# Altium project Teleoperation_V1.1.PrjPcb (part 2 of 2)

## Sheet rp2040.SchDoc
size A3
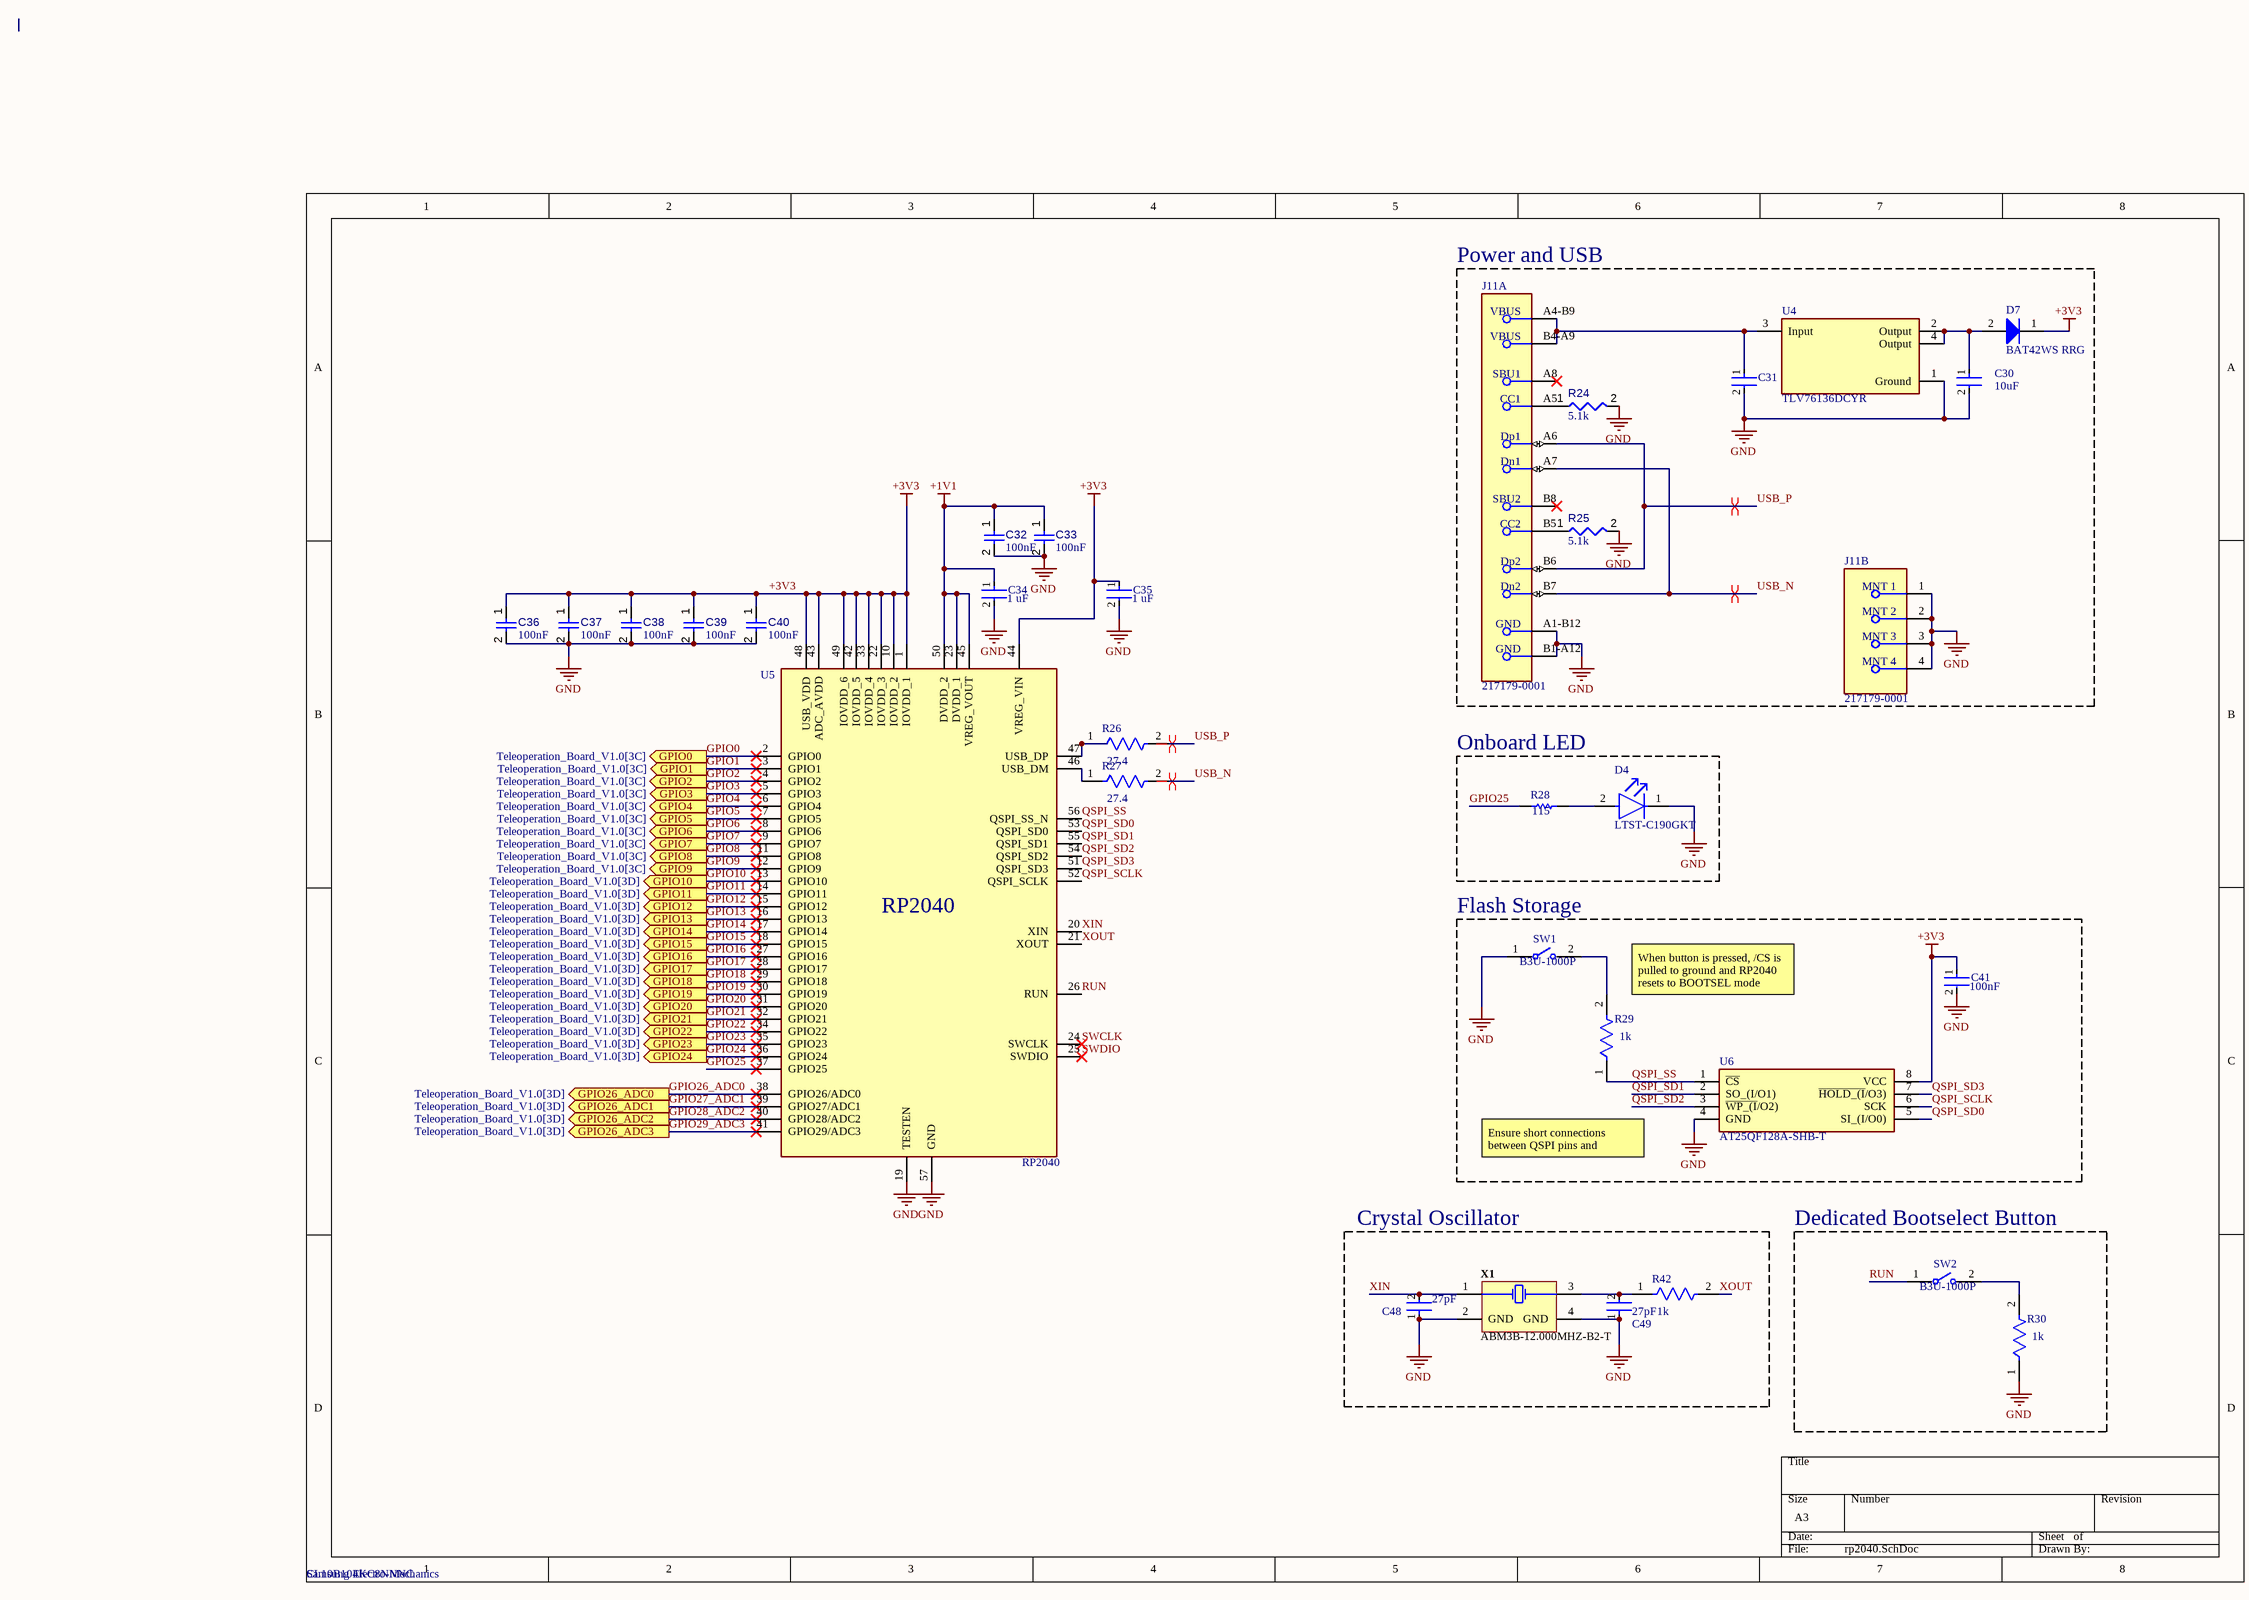
[diagram p2: rp2040.SchDoc]

### Parts
C30  Capacitance: 10uF  [FP-GRT188-0_2-MFG]  (hidden comment: GRT188R61E106ME13D)
C31  UMK107AB7105KA-T  [FP-0603-L_1_6_0_15-W_0_8-IPC_C]  (value not drawn)
C32  value 100nF  [CAPC1608X90N]  (hidden comment: CL10B104KC8NNNC)
C33  value 100nF  [CAPC1608X90N]  (hidden comment: CL10B104KC8NNNC)
C34  CC0603KPX7R7BB105  [FP-CC0603-DA-MFG]  (value not drawn)
C35  CC0603KPX7R7BB105  [FP-CC0603-DA-MFG]  (value not drawn)
C36  value 100nF  [CAPC1608X90N]  (hidden comment: CL10B104KC8NNNC)
C37  value 100nF  [CAPC1608X90N]  (hidden comment: CL10B104KC8NNNC)
C38  value 100nF  [CAPC1608X90N]  (hidden comment: CL10B104KC8NNNC)
C39  value 100nF  [CAPC1608X90N]  (hidden comment: CL10B104KC8NNNC)
C40  value 100nF  [CAPC1608X90N]  (hidden comment: CL10B104KC8NNNC)
C41  Manufacturer: Samsung Electro-Mechanics  [FP-CGA3E-0_3-0_1-IPC_A]  (hidden comment: CL10B104KC8NNNC)
C48  C0603C270J5GACTU  [FP-C0603C-CF-MFG]  (value not drawn)
C49  C0603C270J5GACTU  [FP-C0603C-CF-MFG]  (value not drawn)
D4  LTST-C190GKT  [FP-LTST-C190GKT-MFG]
D7  BAT42WS RRG  [BAT42WS RRG-Footprint-1]
J11  217179-0001  [FP-2171790001-MFG]  (parts A,B of 2)
R24  value 5.1k  [RESC1608X55N]  (hidden comment: ERJ-3EKF5101V)
R25  value 5.1k  [RESC1608X55N]  (hidden comment: ERJ-3EKF5101V)
R26  CRCW060327R4FKEA  [FP-CRCW0603-e3-MFG]  (value not drawn)
R27  CRCW060327R4FKEA  [FP-CRCW0603-e3-MFG]  (value not drawn)
R28  ERJ-3EKF1150V  [RESC1608X55X30NL15T15]  (value not drawn)
R29  RC0603FR-071KL  [FP-RC0603-0_55-IPC_C]  (value not drawn)
R30  RC0603FR-071KL  [FP-RC0603-0_55-IPC_C]  (value not drawn)
R42  RC0603FR-071KL  [FP-RC0603-0_55-IPC_C]  (value not drawn)
SW1  B3U-1000P  [FP-B3U-1000P-MFG]
SW2  B3U-1000P  [FP-B3U-1000P-MFG]
U4  TLV76136DCYR  [TLV76136DCYR-Footprint-1]
U5  RP2040  [RP2040TR7]
U6  AT25QF128A-SHB-T  [SOIC127P790X216-8N]
X1  ABM3B-12.000MHZ-B2-T  [ABRA-ABM3B-4_V]

### Blocks framed on the sheet
Power and USB: C30 C31 D7 J11 R24 R25 U4
Onboard LED: D4 R28
Flash Storage: C41 R29 SW1 U6
Crystal Oscillator: C48 C49 R42 X1
Dedicated Bootselect Button: R30 SW2

### Ports
GPIO0 (out, see Teleoperation_Board_V1.0[3C]), GPIO1 (out, see Teleoperation_Board_V1.0[3C]), GPIO2 (out, see Teleoperation_Board_V1.0[3C]), GPIO3 (out, see Teleoperation_Board_V1.0[3C]), GPIO4 (out, see Teleoperation_Board_V1.0[3C]), GPIO5 (out, see Teleoperation_Board_V1.0[3C]), GPIO6 (out, see Teleoperation_Board_V1.0[3C]), GPIO7 (out, see Teleoperation_Board_V1.0[3C]), GPIO8 (out, see Teleoperation_Board_V1.0[3C]), GPIO9 (out, see Teleoperation_Board_V1.0[3C]), GPIO10 (out, see Teleoperation_Board_V1.0[3D]), GPIO11 (out, see Teleoperation_Board_V1.0[3D]), GPIO12 (out, see Teleoperation_Board_V1.0[3D]), GPIO13 (out, see Teleoperation_Board_V1.0[3D]), GPIO14 (out, see Teleoperation_Board_V1.0[3D]), GPIO15 (out, see Teleoperation_Board_V1.0[3D]), GPIO16 (out, see Teleoperation_Board_V1.0[3D]), GPIO17 (out, see Teleoperation_Board_V1.0[3D]), GPIO18 (out, see Teleoperation_Board_V1.0[3D]), GPIO19 (out, see Teleoperation_Board_V1.0[3D]), GPIO20 (out, see Teleoperation_Board_V1.0[3D]), GPIO21 (out, see Teleoperation_Board_V1.0[3D]), GPIO22 (out, see Teleoperation_Board_V1.0[3D]), GPIO23 (out, see Teleoperation_Board_V1.0[3D]), GPIO24 (out, see Teleoperation_Board_V1.0[3D]), GPIO26_ADC0 (out, see Teleoperation_Board_V1.0[3D]), GPIO26_ADC1 (out, see Teleoperation_Board_V1.0[3D]), GPIO26_ADC2 (out, see Teleoperation_Board_V1.0[3D]), GPIO26_ADC3 (out, see Teleoperation_Board_V1.0[3D])

### Nets
+1V1: C32.1 C33.1 C34.1 U5.23(DVDD_1) U5.45(VREG_VOUT) U5.50(DVDD_2)
+3V3: C35.1 C36.1 C37.1 C38.1 C39.1 C40.1 C41.1 D7.1(K) U5.1(IOVDD_1) U5.10(IOVDD_2) U5.22(IOVDD_3) U5.33(IOVDD_4) U5.42(IOVDD_5) U5.43(ADC_AVDD) U5.44(VREG_VIN) U5.48(USB_VDD) U5.49(IOVDD_6) U6.8(VCC)
GND: C30.2 C31.2 C32.2 C33.2 C34.2 C35.2 C36.2 C37.2 C38.2 C39.2 C40.2 C41.2 C48.1 C49.1 D4.1(C) J11.1(MNT_1) J11.2(MNT_2) J11.3(MNT_3) J11.4(MNT_4) J11.A1-B12(GND) J11.B1-A12(GND) R24.2 R25.2 R30.1 SW1.1 U4.1(Ground) U5.19(TESTEN) U5.57(GND) U6.4(GND) X1.2(GND) X1.4(GND)
GPIO0: U5.2(GPIO0) ; port GPIO0
GPIO1: U5.3(GPIO1) ; port GPIO1
GPIO2: U5.4(GPIO2) ; port GPIO2
GPIO3: U5.5(GPIO3) ; port GPIO3
GPIO4: U5.6(GPIO4) ; port GPIO4
GPIO5: U5.7(GPIO5) ; port GPIO5
GPIO6: U5.8(GPIO6) ; port GPIO6
GPIO7: U5.9(GPIO7) ; port GPIO7
GPIO8: U5.11(GPIO8) ; port GPIO8
GPIO9: U5.12(GPIO9) ; port GPIO9
GPIO10: U5.13(GPIO10) ; port GPIO10
GPIO11: U5.14(GPIO11) ; port GPIO11
GPIO12: U5.15(GPIO12) ; port GPIO12
GPIO13: U5.16(GPIO13) ; port GPIO13
GPIO14: U5.17(GPIO14) ; port GPIO14
GPIO15: U5.18(GPIO15) ; port GPIO15
GPIO16: U5.27(GPIO16) ; port GPIO16
GPIO17: U5.28(GPIO17) ; port GPIO17
GPIO18: U5.29(GPIO18) ; port GPIO18
GPIO19: U5.30(GPIO19) ; port GPIO19
GPIO20: U5.31(GPIO20) ; port GPIO20
GPIO21: U5.32(GPIO21) ; port GPIO21
GPIO22: U5.34(GPIO22) ; port GPIO22
GPIO23: U5.35(GPIO23) ; port GPIO23
GPIO24: U5.36(GPIO24) ; port GPIO24
GPIO25: R28.1 U5.37(GPIO25)
GPIO26_ADC0: U5.38(GPIO26/ADC0) ; port GPIO26_ADC0
GPIO27_ADC1: U5.39(GPIO27/ADC1) ; port GPIO26_ADC1
GPIO28_ADC2: U5.40(GPIO28/ADC2) ; port GPIO26_ADC2
GPIO29_ADC3: U5.41(GPIO29/ADC3) ; port GPIO26_ADC3
QSPI_SCLK: U5.52(QSPI_SCLK) U6.6(SCK)
QSPI_SD0: U5.53(QSPI_SD0) U6.5(SI_(I/O0))
QSPI_SD1: U5.55(QSPI_SD1) U6.2(SO_(I/O1))
QSPI_SD2: U5.54(QSPI_SD2) U6.3(~{WP_(I}/O2))
QSPI_SD3: U5.51(QSPI_SD3) U6.7(~{HOLD_(I}/O3))
QSPI_SS: R29.1 U5.56(QSPI_SS_N) U6.1(~{CS})
RUN: SW2.1 U5.26(RUN)
SWCLK: U5.24(SWCLK)
SWDIO: U5.25(SWDIO)
USB_N: J11.A7(Dn1) J11.B7(Dn2) R27.2
USB_P: J11.A6(Dp1) J11.B6(Dp2) R26.2
XIN: C48.2 U5.20(XIN) X1.1(X1)
XOUT: R42.2 U5.21(XOUT)
NetC30_1: C30.1 D7.2(A) U4.2(Output) U4.4(Output)
NetC31_1: C31.1 J11.A4-B9(VBUS) J11.B4-A9(VBUS) U4.3(Input)
NetC49_2: C49.2 R42.1 X1.3(X2)
NetD4_2: D4.2(A) R28.2
NetJ11_A5: J11.A5(CC1) R24.1
NetJ11_B5: J11.B5(CC2) R25.1
NetR26_1: R26.1 U5.47(USB_DP)
NetR27_1: R27.1 U5.46(USB_DM)
NetR29_2: R29.2 SW1.2
NetR30_2: R30.2 SW2.2

Not connected (* = marked no-connect by the designer): J11 A8(SBU1)* B8(SBU2)*

### Layout directives
differential pair: (no net found under the mark), USB_N, USB_P

### Notes on the sheet
- (near C34) 1 uF
- (near C35) 1 uF
- 27.4
- (near R27) 27.4
- (near R28) 115
- (near U5) RP2040
- (near R29) 1k
- (near R29) When button is pressed, /CS is pulled to ground and RP2040 resets to BOOTSEL mode
- (near C41) 100nF
- Ensure short connections between QSPI pins and RP2040
- (near C48) 27pF
- 27pF
- (near R42) 1k
- (near R30) 1k

### Library data of the parts
C30 = CMP-06035-032378-1: Multi-Layer Ceramic Capacitor 10uF 25V X5R ±20% 0603 Paper T/R; Thickness: 0.035inch; Case/Package: 0603; Voltage Rating: 25V; Mount: Surface Mount; Packaging: Tape and Reel; Width: 0.031inch; Max Operating Temperature: 85°C; Case Code (Imperial): 0603; Ratings: AEC-Q200; Tolerance: 20%; Min Operating Temperature: -55°C; Case Code (Metric): 1608; Length: 0.063inch
C31 = CMP-2000-07531-4: Ceramic Capacitor General Use 1uF ±10% 50V X7R 0603; Series: M; Width: 0.031inch; Mount: Surface Mount; Radiation Hardening: No; Voltage Rating (DC): 50V; Packaging: Tape and Reel; Termination: SMD/SMT; Depth: 0.8mm; Case Code (Metric): 1608; Case Code (Imperial): 0603; Height: 0.8mm; Voltage Rating: 50V; Package Quantity: 1; Halogen Free: Halogen Free; Dielectric: X7R; Min Operating Temperature: -55°C; Length: 1.6mm; Construction: Flat; Tolerance: 10%; Thickness: 0.037inch; Max Operating Temperature: 125°C; Case/Package: 0603; Capacitance: 1uF; RoHS Compliant: Yes
C32 C33 C36-C40 = CMP-001-00090-1: Ceramic Capacitor, Multilayer, Ceramic, 100V, 10% +Tol, 10% -Tol, X7R, 15% TC, 0.1uF, Surface Mount, 0603; Case/Package: 0603; Min Operating Temperature: -55°C; Mounting Technology: Surface Mount; Capacitor Type: Ceramic; Max Operating Temperature: 125°C; Pins: 2; RoHS Compliant: Yes
C34 C35 = CMP-03422-001047-1: CC0603 1 uF X7R 10.00% 16 V; Manufacturer: YAGEO; Temperature Coefficient: 15%; Tolerance: 0.1; Voltage Rating: 16 V; Capacitance: 1 uF; Material: Ceramic; Value: 1 uF; Device Class L3: Ceramic Capacitors; Temperature Characteristic: X7R; Device Class L2: Capacitors; Temperature Range Low: -55°C; Footprint Url: http://www.yageo.com/exep/pages/download/literatures/UPY-C_GEN_24.pdf; Device Class L1: Passive Components; Temperature: -55°C to +125°C; RoHS: TRUE; ComponentLink2URL: http://www.yageo.com/documents/recent/UPY-GPHC_X7R_6.3V-to-50V_18.pdf; Mouser Description: Cap Ceramic 1uF 16V X7R 10% SMD 0603 125°C Paper T/R; Octopart: https://octopart.com/cc0603kpx7r7bb105-yageo-25629533; Automotive: No; Height: 0.9mm; Voltage: 16 V; Lead Free: Yes; Category: Cap; Package: CC0603-DA; Temperature Range High: +125°C; Manufacturer Part Number: CC0603KPX7R7BB105; ComponentLink2Description: Datasheet
C41 = CMP-2000-07546-2: Cap Ceramic 100nF 50V X7R 10% Pad SMD 0603 +125°C Automotive T/R; Weight: 7.1E-05oz; Composition: Ceramic; Max Operating Temperature: 125°C; Termination: SMD/SMT; Dielectric: X7R; Length: 1.6mm; Package Quantity: 1; REACH SVHC: No SVHC; Lead Free: Lead Free; Case Code (Metric): 1608; Min Operating Temperature: -55°C; Packaging: Tape and Reel; Tolerance: 10%; Voltage Rating: 50V; Case Code (Imperial): 0603; Capacitance: 100nF; Case/Package: 0603; Voltage Rating (DC): 50V; Depth: 0.8mm; Radiation Hardening: No; Ratings: AEC-Q200; Mount: Surface Mount; Voltage: 50V; Thickness: 0.035inch; Width: 0.8mm; Height: 0.8mm; Manufacturer Part Number: CL10B104KC8NNNC
C48 C49 = CMP-2006-03314-2: CAP CER 27PF 50V C0G/NP0 0603; Manufacturer: KEMET; Tolerance: 0.05; Material: Ceramic; Automotive Grade: Grade 1; Temperature Characteristic: C0G; Temperature Coefficient: 30ppm/°C; RoHS: TRUE; Lead Free: Yes; Automotive: Yes; Category: Cap; Digikey Description: CAP CER 27PF 50V C0G/NP0 0603; Device Class L3: Ceramic Capacitors; Capacitance: 27 pF; Temperature Range High: +125°C; Octopart: https://octopart.com/c0603c270j5gactu-kemet-136059; Value: 27 pF; Temperature Range Low: -55°C; ComponentLink2URL: https://api.kemet.com/component-edge/download/datasheet/C0603C100J5GACAUTO.pdf; Device Class L2: Capacitors; Mouser Description: Multilayer Ceramic Capacitors MLCC - SMD/SMT 50volts 27pF C0G 5%; Device Class L1: Passive Components; ComponentLink2Description: Datasheet; Voltage Rating: 50 V; Package: C0603C-CF; Height: 0.87mm; Temperature: -55°C to +125°C; Manufacturer Part Number: C0603C270J5GACTU
D4 = CMP-22017-000005-2: LED GREEN CLEAR CHIP SMD; Dominant Wavelength: 569nm; Reverse Voltage: 5V; Lens Color: Colorless; Viewing Angle: 130°; Voltage: 2V; Forward Current: 30mA; Power Dissipation: 100mW; Luminous Intensity: 6mcd; Number of LEDs: 1; Forward Voltage: 2.1V; Wavelength: 565nm; Test Current: 10mA; Min Operating Temperature: -55°C; Lens Style: Clear; Mount: Surface Mount; Width: 0.8mm; Packaging: Tape and Reel; Lens Transparency: Clear; Case Code (Metric): 1608; Depth: 0.8mm; Case Code (Imperial): 0603; Case/Package: 0603; Number of Pins: 2; Max Operating Temperature: 85°C; Lead Free: Lead Free; Number of Elements: 1; Length: 1.6mm; Height: 0.8mm; Package Quantity: 1; Power Rating: 100mW; Radiation Hardening: No; Illumination Color: Green; Color: Green
D7 = CMP-004-00032-1: Schottky Diode, 30V, 0.2A, Sod-323F Rohs Compliant: Yes; Manufacturer Lifecycle Status: ACTIVE; Lifecycle Status: Production
J11 = CMP-04767-000028-2: CONN RCP USB2.0 TYP C 24P SMD RA; NexarPartId: 117190526; Gender: Receptacle; Number of Contacts: 16; Current Rating: 1.25A; Voltage Rating: 30V; Min Operating Temperature: -40°C; USB Standard: USB 2.0; Height: 3.36mm; Contact Material: Gold, Nickel; Max Operating Temperature: 85°C
R24 R25 = CMP-009-00178-1: Fixed Resistor, Metal Glaze/thick Film, 0.1W, 5100ohm, 75V, 1% +/-Tol, 100ppm/Cel, Surface Mount, 0603; Power: 100mW; Case/Package: 0603; Tolerance: 1%; Min Operating Temperature: -55°C; Max Operating Temperature: 155°C; RoHS Compliant: Yes; Mounting Technology: Surface Mount; Pins: 2
R26 R27 = CMP-2000-03146-2: RES Thick Film, 27.4Ω, 1%, 0.1W, 100ppm/°C, 0603; Voltage Rating (DC): 75V; Max Power Dissipation: 100mW; Resistance: 27.4R; Case Code (Metric): 1608; Length: 1.55mm; Depth: 0.85mm; Package Quantity: 10; Voltage Rating: 75V; Power Rating: 100mW; Weight: 7.1E-05oz; Max Operating Temperature: 155°C; Temperature Coefficient: 100ppm/°C; Packaging: Tape and Reel; Lead Free: Lead Free; Number of Pins: 2; Height: 0.45mm; Military Standard: Not; Features: Automotive AEC-Q200; Contact Plating: Tin; Min Operating Temperature: -55°C; Composition: Thick Film; Mount: Surface Mount; Case/Package: 0603; Case Code (Imperial): 0603; Tolerance: 1%; Width: 0.85mm; Radiation Hardening: No; Number of Terminations: 2; Termination: SMD/SMT
R28 = CMP-2000-00205-1: Manufacturer: Panasonic; Part Number: ERJ-3EKF1150V
R29 R30 R42 = CMP-1659-00009-5: RES 1K OHM 1% 1/10W 0603; Resistance: 1kR; Voltage Rating: 50V; Power Rating: 100mW; Temperature Coefficient: 100ppm/°C; Military Standard: Not; REACH SVHC: No SVHC; Size Code: 0603; Features: Moisture Resistant; Number of Terminations: 2; Technology: THICK FILM; Series: RC; Case Code (Metric): 1608; Resistance Tolerance: 1%; Resistor Type: Thick Film; Termination: SMD/SMT; Contact Plating: Tin; Radiation Hardening: No; Min Operating Temperature: -55°C; Max Operating Temperature: 155°C; Packaging: Tape and Reel; Max Power Dissipation: 100mW; RoHS Compliant: Yes; Height: 0.45mm; Lead Free: Lead Free; Case/Package: 0603; Length: 1.6mm; Tolerance: 1%; Case Code (Imperial): 0603; Construction: Rectangular; Depth: 0.8mm
SW1 SW2 = CMP-2100-03586-2: SWITCH TACTILE SPST-NO 0.05A 12V; Contact Resistance: 100mR; Operating Force: 1.5N; Max Current Rating: 50mA; Switch Travel: 0.15mm; Actuator Type: Standard; Mechanical Life: 200000Cycles; Ratings: Dust Proof; Illumination Type: Non-Illuminated; Throw Configuration: SPST; Actuator Length: 0.4mm; Switch Function: Off-Mom; Height: 1.2mm; Width: 3mm; Weight: 0.000776oz; Contact Material: Silver; Max Voltage Rating (DC): 12V; Insulation Resistance: 100MR; Lead Free: Lead Free; Current Rating: 50mA; Termination: SMD/SMT; Length: 4mm; Voltage Rating (DC): 12V; Contact Current Rating: 50mA; Orientation: Straight; Depth: 2.5mm; Max Operating Temperature: 70°C; Packaging: Tape and Reel; Min Operating Temperature: -25°C; Package Quantity: 1; Mount: Surface Mount; Electrical Life: 200000Cycles
U4 = CMP-019-00054-3: 1A 16V high-PSRR linear voltage regulator 4-SOT-223 -40 to 125; Manufacturer Lifecycle Status: ACTIVE; Length: 6.5mm; RoHS: Compliant; Thickness: 1.6mm; Width: 3.5mm; Case/Package: SOT-223; Lifecycle Status: Production; Pins: 4; Height: 1.8mm
U5 = RP2040: Integrated Circuit; Manufacturer_Name: RASPBERRY-PI; Datasheet Link: https://datasheets.raspberrypi.org/rp2040/rp2040-datasheet.pdf; Height: 0.9mm; Manufacturer_Part_Number: RP2040
U6 = AT25QF128A-SHB-T: Integrated Circuit; Manufacturer_Name: Renesas Electronics; Datasheet Link: https://www.renesas.com/us/en/products/memory-logic/non-volatile-memory/spi-nor-flash/dual-quad-spi-memory/at25qf128a-128mbit-3v-spi-serial-flash-memory-dual-io-and-quad-io-support; Height: 2.16mm; Manufacturer_Part_Number: AT25QF128A-SHB-T; Mouser Part Number: 988-AT25QF128A-SHB-T; Mouser Price/Stock: https://www.mouser.co.uk/ProductDetail/Renesas-Dialog/AT25QF128A-SHB-T?qs=IS%252B4QmGtzzpXzyCQuAC%2FQA%3D%3D
X1 = CMP-003-00015-2: Ceramic SMD Crystal, 12 MHz, +/- 20 ppm, 18 pF, -20 to 70 degC, 4-Pin SMD, RoHS, Tape and Reel; Manufacturer: Abracon; ESR: 70; Load Capacitance: 18pF; Tolerance: 20ppm; Frequency: 12MHz; Resistance: 70Ohm; Mounting Technology: SM; Packaging: TapeandReel; Datasheet URL: http://www.abracon.com/Resonators/abm3b.pdf; Manufacturer URL: http://www.abracon.com/; RoHS Compliant: True; Frequency Tolerance: 20ppm; Datasheet Version: Aug-15; Max Operating Temperature: 70°C; Package Reference: ABM3B; Min Operating Temperature: -20°C; Pins: 4; Package Quantity: 1000; Package Description: 4-Pin Surface Mount Device, Body 5 x 3.2 mm; Case/Package: CSMD

## Sheet voltage_dividers.SchDoc
size A
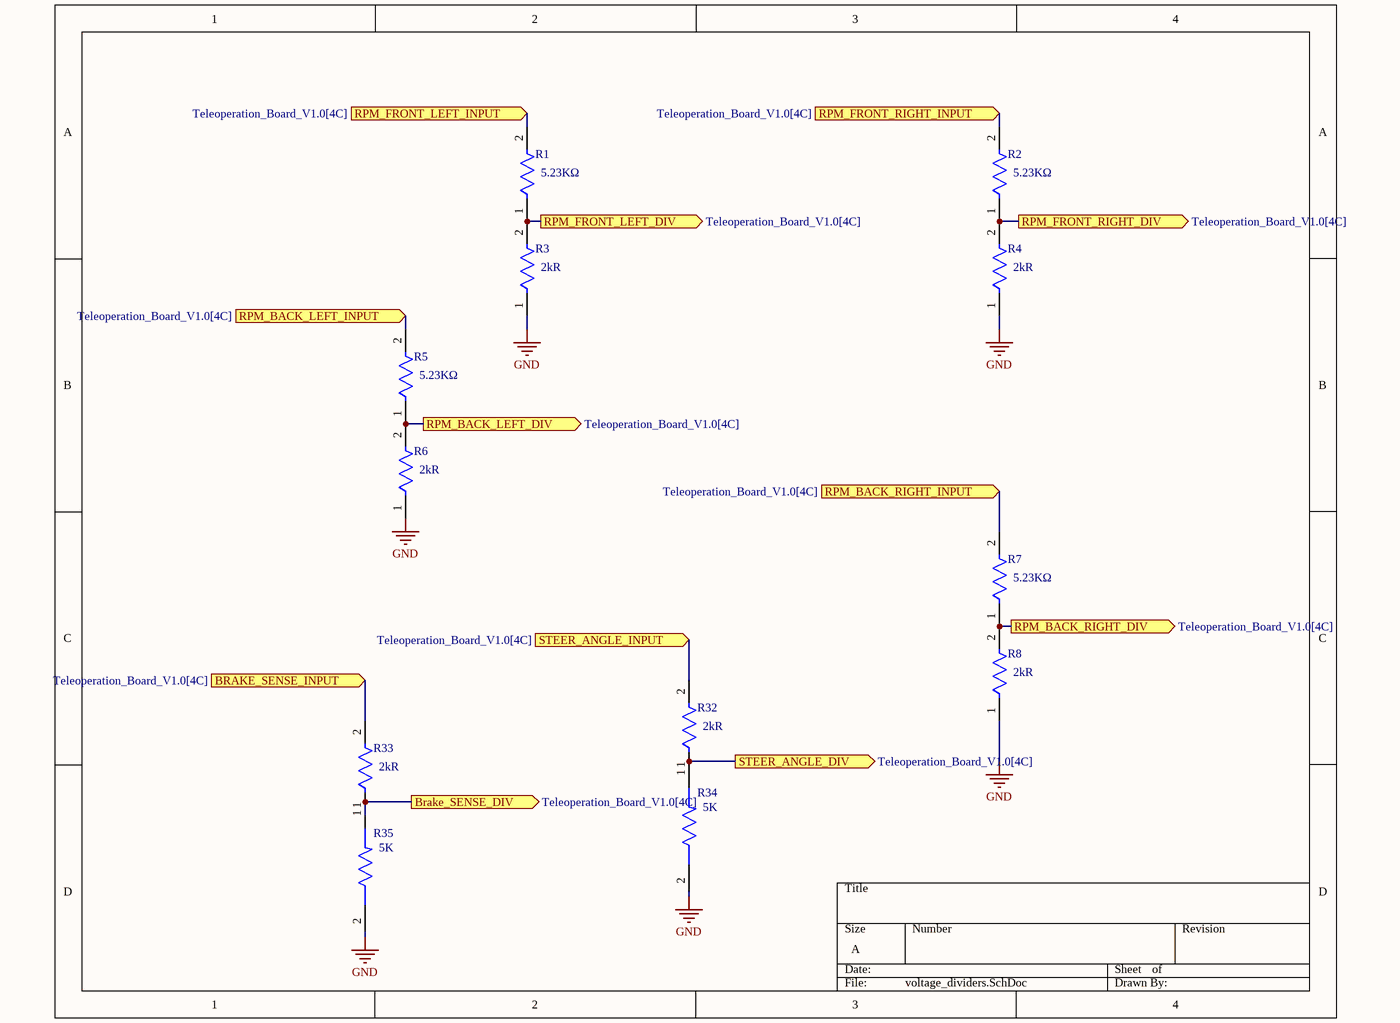
[diagram p3: voltage_dividers.SchDoc]

### Parts
R1  Resistance: 5.23KΩ  [FP-RT0603-MFG]  (hidden comment: RT0603BRD075K23L)
R2  Resistance: 5.23KΩ  [FP-RT0603-MFG]  (hidden comment: RT0603BRD075K23L)
R3  Resistance: 2kR  [FP-ERA3A-IPC_C]  (hidden comment: ERA3AEB202V)
R4  Resistance: 2kR  [FP-ERA3A-IPC_C]  (hidden comment: ERA3AEB202V)
R5  Resistance: 5.23KΩ  [FP-RT0603-MFG]  (hidden comment: RT0603BRD075K23L)
R6  Resistance: 2kR  [FP-ERA3A-IPC_C]  (hidden comment: ERA3AEB202V)
R7  Resistance: 5.23KΩ  [FP-RT0603-MFG]  (hidden comment: RT0603BRD075K23L)
R8  Resistance: 2kR  [FP-ERA3A-IPC_C]  (hidden comment: ERA3AEB202V)
R32  Resistance: 2kR  [FP-ERA3A-IPC_C]  (hidden comment: ERA3AEB202V)
R33  Resistance: 2kR  [FP-ERA3A-IPC_C]  (hidden comment: ERA3AEB202V)
R34  MCT06030D5001BP500  [RESC1608X55N]  (value not drawn)
R35  MCT06030D5001BP500  [RESC1608X55N]  (value not drawn)

### Ports
Brake_SENSE_DIV (out, see Teleoperation_Board_V1.0[4C]), BRAKE_SENSE_INPUT (in, see Teleoperation_Board_V1.0[4C]), RPM_BACK_LEFT_DIV (out, see Teleoperation_Board_V1.0[4C]), RPM_BACK_LEFT_INPUT (in, see Teleoperation_Board_V1.0[4C]), RPM_BACK_RIGHT_DIV (out, see Teleoperation_Board_V1.0[4C]), RPM_BACK_RIGHT_INPUT (in, see Teleoperation_Board_V1.0[4C]), RPM_FRONT_LEFT_DIV (out, see Teleoperation_Board_V1.0[4C]), RPM_FRONT_LEFT_INPUT (in, see Teleoperation_Board_V1.0[4C]), RPM_FRONT_RIGHT_DIV (out, see Teleoperation_Board_V1.0[4C]), RPM_FRONT_RIGHT_INPUT (in, see Teleoperation_Board_V1.0[4C]), STEER_ANGLE_DIV (out, see Teleoperation_Board_V1.0[4C]), STEER_ANGLE_INPUT (in, see Teleoperation_Board_V1.0[4C])

### Nets
GND: R3.1 R4.1 R6.1 R8.1 R34.2 R35.2
BrakeSense: R33.2 ; port BRAKE_SENSE_INPUT
GPIO6: R1.1 R3.2 ; port RPM_FRONT_LEFT_DIV
GPIO7: R2.1 R4.2 ; port RPM_FRONT_RIGHT_DIV
GPIO8: R7.1 R8.2 ; port RPM_BACK_RIGHT_DIV
GPIO9: R5.1 R6.2 ; port RPM_BACK_LEFT_DIV
GPIO27_ADC1: R33.1 R35.1 ; port Brake_SENSE_DIV
GPIO28_ADC2: R32.1 R34.1 ; port STEER_ANGLE_DIV
RPM_BACK_LEFT: R5.2 ; port RPM_BACK_LEFT_INPUT
RPM_BACK_RIGHT: R7.2 ; port RPM_BACK_RIGHT_INPUT
RPM_FRONT_LEFT: R1.2 ; port RPM_FRONT_LEFT_INPUT
RPM_FRONT_RIGHT: R2.2 ; port RPM_FRONT_RIGHT_INPUT
SteerAngle: R32.2 ; port STEER_ANGLE_INPUT

### Notes on the sheet
- (near R34) 5K
- (near R35) 5K

### Library data of the parts
R1 R2 R5 R7 = CMP-03412-031710-1: RES SMD 5.23K OHM 0.1% 1/10W; Manufacturer: Yageo; Tolerance: 0.001; Voltage Rating: 75V; Value: 5.23KΩ; Power Rating: 0.1W; Temperature Coefficient: 25 ppm/°C; Composition: Thin Film; Device Class L2: Resistors; Device Class L1: Passive Components; Mouser Description: Thin Film Resistors 1/10W 5.23K ohm .1% 25ppm; Package: RT0603; Automotive: No; Device Class L3: Chip SMD Resistors; ComponentLink2URL: http://www.yageo.com/documents/recent/PYu-RT_1-to-0.01_RoHS_L_9.pdf; Temperature: -55°C to +155°C; Manufacturer Part Number: RT0603BRD075K23L; Height: 0.55mm; Temperature Range High: +155°C; Lead Free: Yes; Series: RT; Ipc Land Pattern Name: RESC16080X45; Temperature Range Low: -55°C; ComponentLink2Description: Datasheet; Octopart: https://octopart.com/rt0603brd075k23l-yageo-1448416; RoHS: TRUE; Digikey Description: RES SMD 5.23K OHM 0.1% 1/10W; Footprint Url: http://www.yageo.com/exep/pages/download/literatures/PYu-R_Mount_10.pdf; Category: Res
R3 R4 R6 R8 R32 R33 = CMP-2000-00945-2: RES SMD 2K OHM 0.1% 1/10W 0603; Max Power Dissipation: 100mW; Voltage Rating (DC): 75V; Temperature Coefficient: 25ppm/°C; REACH SVHC: No SVHC; Number of Terminations: 2; RoHS Compliant: Yes; Case Code (Metric): 1608; Package Quantity: 5000; Width: 0.8mm; Mount: Surface Mount; Series: ERA-3A; Number of Pins: 2; Height: 0.45mm; Military Standard: Not; Packaging: Tape and Reel; Resistor Type: Thin Film; Lead Free: Lead Free; Construction: Rectangular; Max Operating Temperature: 155°C; Contact Plating: Tin; Termination: SMD/SMT; Technology: THIN FILM; Length: 1.6mm; Power Rating: 100mW; Resistance Tolerance: 0.1%; Working Voltage: 75V; Voltage Rating: 75V; Depth: 0.8mm; Case Code (Imperial): 0603; Radiation Hardening: No; Case/Package: 0603; Tolerance: 0.1%; Min Operating Temperature: -55°C
R34 R35 = MCT06030D5001BP500: Resistor; Manufacturer_Name: Vishay; Datasheet Link: http://www.vishay.com/docs/28705/mcx0x0xpro.pdf; Height: 0.55mm; Manufacturer_Part_Number: MCT06030D5001BP500; Arrow Part Number: MCT06030D5001BP500; Arrow Price/Stock: https://www.arrow.com/en/products/mct06030d5001bp500/vishay?utm_currency=USD&region=nac

## Sheet motor_interfaces.SchDoc
size B
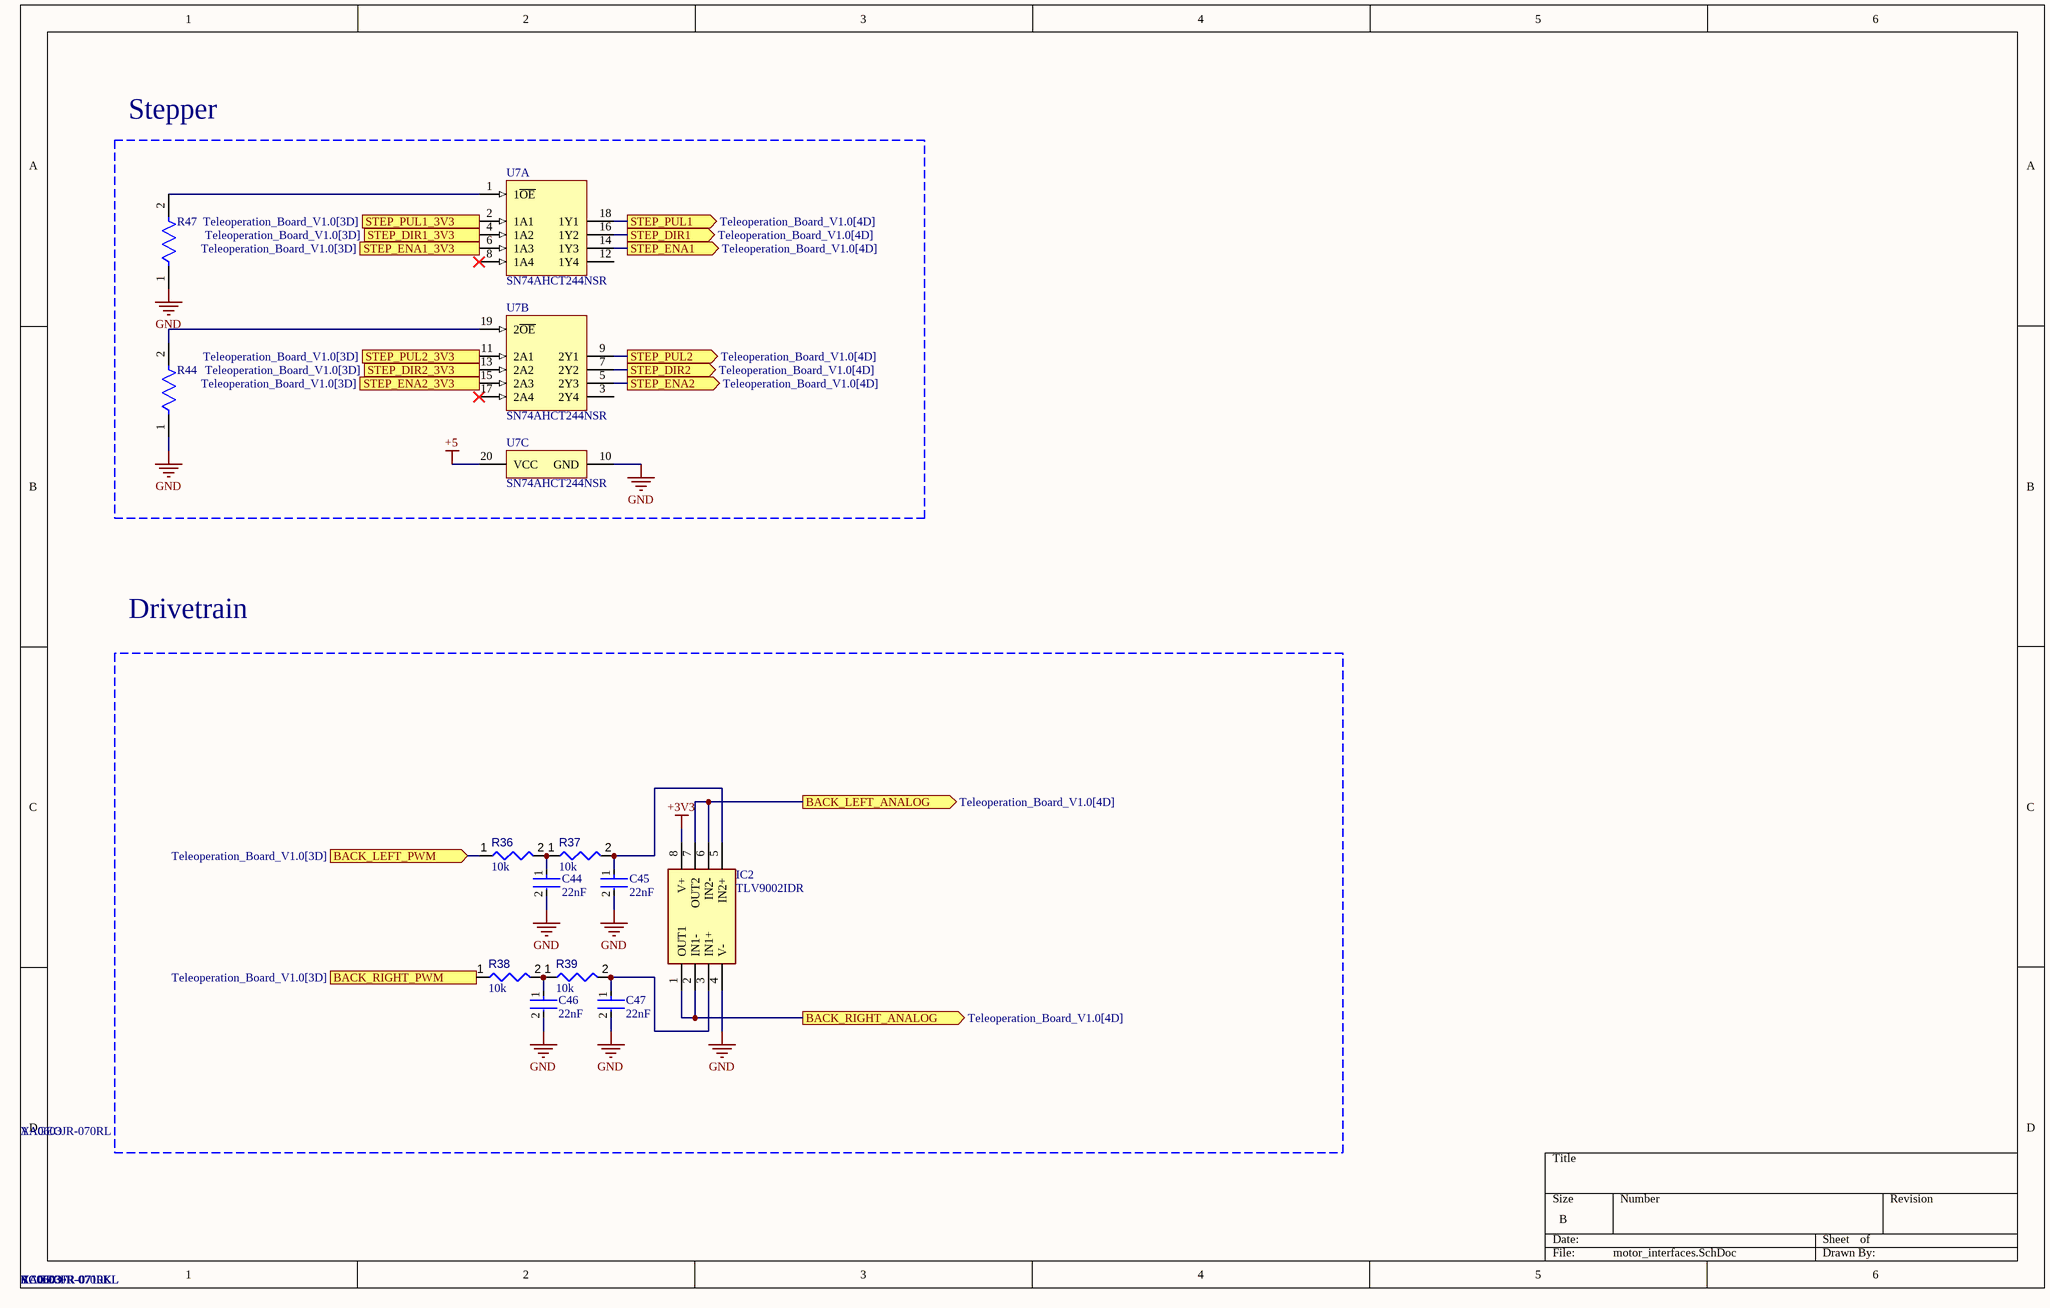
[diagram p4: motor_interfaces.SchDoc]

### Parts
C44  22nF  [FP-CC0603-DA-MFG]
C45  22nF  [FP-CC0603-DA-MFG]
C46  22nF  [FP-CC0603-DA-MFG]
C47  22nF  [FP-CC0603-DA-MFG]
IC2  TLV9002IDR  [SOIC127P600X175-8N]
R36  value 10k  Manufacturer: YAGEO  Manufacturer Part Number: RC0603FR-0710KL  [RESC1608X55X25ML10T15]  (hidden comment: Resistor 10k +/-1% 0603 100 mW)
R37  value 10k  Manufacturer: YAGEO  Manufacturer Part Number: RC0603FR-0710KL  [RESC1608X55X25ML10T15]  (hidden comment: Resistor 10k +/-1% 0603 100 mW)
R38  value 10k  Manufacturer: YAGEO  Manufacturer Part Number: RC0603FR-0710KL  [RESC1608X55X25ML10T15]  (hidden comment: Resistor 10k +/-1% 0603 100 mW)
R39  value 10k  Manufacturer: YAGEO  Manufacturer Part Number: RC0603FR-0710KL  [RESC1608X55X25ML10T15]  (hidden comment: Resistor 10k +/-1% 0603 100 mW)
R44  Manufacturer: YAGEO  [FP-AF0603-IPC_C]  (hidden comment: AA0603JR-070RL)
R47  Manufacturer: YAGEO  [FP-AF0603-IPC_C]  (hidden comment: AA0603JR-070RL)
U7  SN74AHCT244NSR  [NS0020A_L]  (parts A,B,C of 3)

### Blocks framed on the sheet
Stepper: R44 R47 U7

### Ports
BACK_LEFT_ANALOG (out, see Teleoperation_Board_V1.0[4D]), BACK_LEFT_PWM (in, see Teleoperation_Board_V1.0[3D]), BACK_RIGHT_ANALOG (out, see Teleoperation_Board_V1.0[4D]), BACK_RIGHT_PWM (in, see Teleoperation_Board_V1.0[3D]), STEP_DIR1 (out, see Teleoperation_Board_V1.0[4D]), STEP_DIR1_3V3 (in, see Teleoperation_Board_V1.0[3D]), STEP_DIR2 (out, see Teleoperation_Board_V1.0[4D]), STEP_DIR2_3V3 (in, see Teleoperation_Board_V1.0[3D]), STEP_ENA1 (out, see Teleoperation_Board_V1.0[4D]), STEP_ENA1_3V3 (in, see Teleoperation_Board_V1.0[3D]), STEP_ENA2 (out, see Teleoperation_Board_V1.0[4D]), STEP_ENA2_3V3 (in, see Teleoperation_Board_V1.0[3D]), STEP_PUL1 (out, see Teleoperation_Board_V1.0[4D]), STEP_PUL1_3V3 (in, see Teleoperation_Board_V1.0[3D]), STEP_PUL2 (out, see Teleoperation_Board_V1.0[4D]), STEP_PUL2_3V3 (in, see Teleoperation_Board_V1.0[3D])

### Nets
+3V3: IC2.8(V+)
+5: U7.20(VCC)
GND: C44.2 C45.2 C46.2 C47.2 IC2.4(V-) R44.1 R47.1 U7.10(GND)
BACK_LEFT_ANALOG: IC2.6(IN2-) IC2.7(OUT2) ; port BACK_LEFT_ANALOG
BACK_RIGHT_ANALOG: IC2.1(OUT1) IC2.2(IN1-) ; port BACK_RIGHT_ANALOG
GPIO2: R36.1 ; port BACK_LEFT_PWM
GPIO3: R38.1 ; port BACK_RIGHT_PWM
GPIO10: U7.2(1A1) ; port STEP_PUL1_3V3
GPIO11: U7.4(1A2) ; port STEP_DIR1_3V3
GPIO12: U7.6(1A3) ; port STEP_ENA1_3V3
GPIO13: U7.11(2A1) ; port STEP_PUL2_3V3
GPIO14: U7.13(2A2) ; port STEP_DIR2_3V3
GPIO15: U7.15(2A3) ; port STEP_ENA2_3V3
STEP_DIR1: U7.16(1Y2) ; port STEP_DIR1
STEP_DIR2: U7.7(2Y2) ; port STEP_DIR2
STEP_ENA1: U7.14(1Y3) ; port STEP_ENA1
STEP_ENA2: U7.5(2Y3) ; port STEP_ENA2
STEP_PUL1: U7.18(1Y1) ; port STEP_PUL1
STEP_PUL2: U7.9(2Y1) ; port STEP_PUL2
NetC44_1: C44.1 R36.2 R37.1
NetC45_1: C45.1 IC2.5(IN2+) R37.2
NetC46_1: C46.1 R38.2 R39.1
NetC47_1: C47.1 IC2.3(IN1+) R39.2
NetR44_2: R44.2 U7.19(2~{OE})
NetR47_2: R47.2 U7.1(1~{OE})

Not connected (* = marked no-connect by the designer): U7 3(2Y4) 8(1A4)* 12(1Y4) 17(2A4)*

### Notes on the sheet
- Drivetrain

### Library data of the parts
C44-C47 = CMP-03422-000397-1: CC0603 22 nF X7R 20.00% 50 V; Manufacturer Part Number: CC0603MRX7R9BB223; Manufacturer: YAGEO; Material: Ceramic; Tolerance: 0.2; Temperature Coefficient: 15%; Voltage: 50 V; Lead Free: Yes; Height: 0.9mm; Device Class L1: Passive Components; RoHS: TRUE; Footprint Url: http://www.yageo.com/exep/pages/download/literatures/UPY-C_GEN_24.pdf; Value: 22 nF; ComponentLink2URL: http://www.yageo.com/documents/recent/UPY-GPHC_X7R_6.3V-to-50V_18.pdf; Automotive: No; Device Class L2: Capacitors; Temperature: -55°C to +125°C; Capacitance: 22 nF; Mouser Description: Surface Mount Ceramic Multilayer Capacitor 0.022uF 20% X7R 50V 0603 Paper T/R; Temperature Range High: +125°C; Temperature Range Low: -55°C; Octopart: https://octopart.com/cc0603mrx7r9bb223-yageo-88025763; Temperature Characteristic: X7R; Package: CC0603-DA; ComponentLink2Description: Datasheet; Category: Cap; Voltage Rating: 50 V; Device Class L3: Ceramic Capacitors
IC2 = TLV9002IDR: Integrated Circuit; Manufacturer_Name: Texas Instruments; Datasheet Link: http://www.ti.com/lit/gpn/tlv9002; Height: 1.75mm; Manufacturer_Part_Number: TLV9002IDR; Mouser Part Number: 595-TLV9002IDR; Mouser Price/Stock: https://www.mouser.co.uk/ProductDetail/Texas-Instruments/TLV9002IDR?qs=xhbEVWpZdWdPu%252BhBN%252BBREg%3D%3D; Arrow Part Number: TLV9002IDR; Arrow Price/Stock: https://www.arrow.com/en/products/tlv9002idr/texas-instruments?utm_currency=USD&region=europe
R36-R39 = CMP-009-00017-5: Chip Resistor, 10 KOhm, +/- 1%, 01 W, -55 to 155 degC, 0603 (1608 Metric); Voltage Rating: 50V; Power: 100mW; RoHS Compliant: True; Min Operating Temperature: -55°C; Pins: 2; Case/Package: 0603; Mounting Technology: SM; Max Operating Temperature: 155°C; Tolerance: 1%
R44 R47 = CMP-03412-040480-1: Anti-Sulfurated Chip Resistors Automotive Grade 0Ω   0603; Max Power Dissipation: 100mW; Resistance: 0R; Tolerance: 5%; RoHS Compliant: Yes; Features: Moisture Resistant; Height: 0.022inch; Length: 0.063inch; Width: 0.031inch; Min Operating Temperature: -55°C; Max Operating Temperature: 155°C; Number of Terminations: 2; Case/Package: 0603; Series: AF; Resistor Type: Thick Film; Packaging: Tape and Reel; Manufacturer Part Number: AA0603JR-070RL
U7 = CMP-0440-01048-3: Octal Buffers/Drivers With 3-State Outputs, NS0020A, LARGE T&R; Manufacturer: Texas Instruments; Bits(#): 8; ICC @ Nom Voltage(Max)(mA): 0.04; F @ Nom Voltage(Max)(Mhz): 110; VCC(Max)(V): 5.5; Input Type: TTL; Output Type: CMOS; VCC(Min)(V): 4.5; Voltage(Nom)(V): 5; Rating: Catalog; tpd @ Nom Voltage(Max)(ns): 9.5; PackageReference: NS0020A; PackageVersion: http://www.ti.com/lit/ml/msop002a/msop002a.pdf; Generic Part Number: SN74AHCT244; DatasheetVersion: SCLS228M; Operating Temperature Range(C): -40 to 85

## Sheet clutch_interface.SchDoc
size A
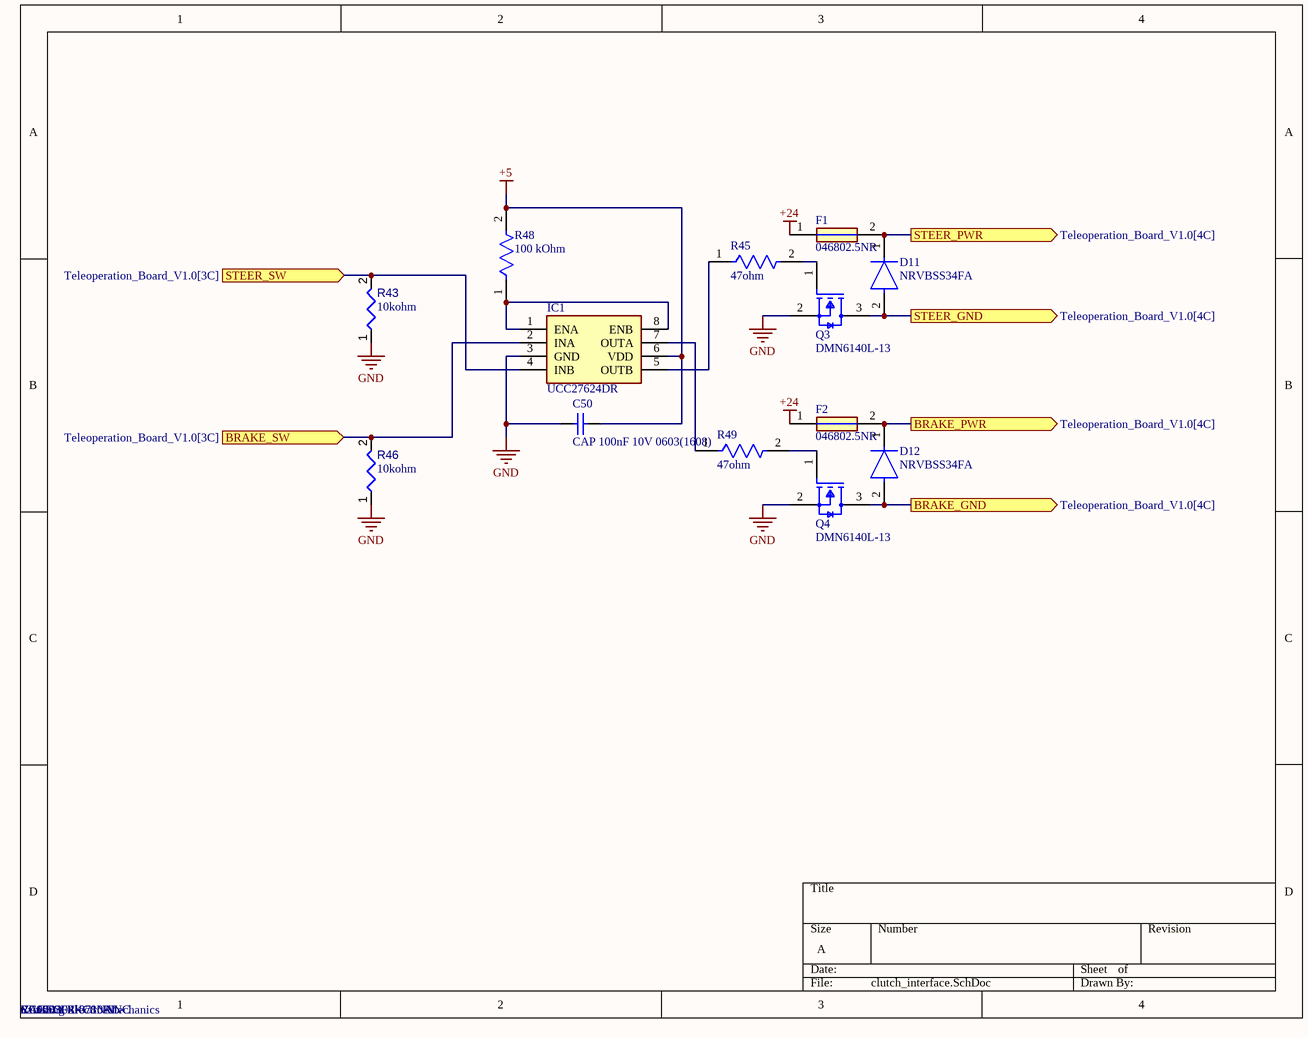
[diagram p5: clutch_interface.SchDoc]

### Parts
C50  CAP 100nF 10V 0603(1608)  Manufacturer: Samsung Electro-Mechanics  Manufacturer Part Number: CL10B104KC8NNNC  [CAPC0603(1608)100_L]
D11  NRVBSS34FA  [FP-425AB-MFG]
D12  NRVBSS34FA  [FP-425AB-MFG]
F1  046802.5NR  [FUSC3215X76N]
F2  046802.5NR  [FUSC3215X76N]
IC1  UCC27624DR  [SOIC127P600X175-8N]
Q3  DMN6140L-13  [FP-SOT23-MFG]
Q4  DMN6140L-13  [FP-SOT23-MFG]
R43  value 10kohm  Manufacturer: YAGEO  Manufacturer Part Number: RC0603FR-0710KL  [RESC1608X55X25ML10T15]  (hidden comment: Resistor 10k +/-1% 0603 100 mW)
R45  47ohm  [FP-RT0603-MFG]
R46  value 10kohm  Manufacturer: YAGEO  Manufacturer Part Number: RC0603FR-0710KL  [RESC1608X55X25ML10T15]  (hidden comment: Resistor 10k +/-1% 0603 100 mW)
R48  100 kOhm  [FP-AC0603-MFG]
R49  47ohm  [FP-RT0603-MFG]

### Ports
BRAKE_GND (out, see Teleoperation_Board_V1.0[4C]), BRAKE_PWR (out, see Teleoperation_Board_V1.0[4C]), BRAKE_SW (in, see Teleoperation_Board_V1.0[3C]), STEER_GND (out, see Teleoperation_Board_V1.0[4C]), STEER_PWR (out, see Teleoperation_Board_V1.0[4C]), STEER_SW (in, see Teleoperation_Board_V1.0[3C])

### Nets
+5: C50.2 IC1.6(VDD) R48.2
+24: F1.1 F2.1
GND: C50.1 IC1.3(GND) Q3.2(S) Q4.2(S) R43.1 R46.1
BRAKE_GND: D12.2(A) Q4.3(D) ; port BRAKE_GND
BRAKE_POWER: D12.1(C) F2.2 ; port BRAKE_PWR
GPIO4: IC1.4(INB) R43.2 ; port STEER_SW
GPIO5: IC1.2(INA) R46.2 ; port BRAKE_SW
STEER_GND: D11.2(A) Q3.3(D) ; port STEER_GND
STEER_POWER: D11.1(C) F1.2 ; port STEER_PWR
NetIC1_1: IC1.1(ENA) IC1.8(ENB) R48.1
NetIC1_5: IC1.5(OUTB) R45.1
NetIC1_7: IC1.7(OUTA) R49.1
NetQ3_1: Q3.1(G) R45.2
NetQ4_1: Q4.1(G) R49.2

### Library data of the parts
C50 = CMP-1035-02579-1: CAP 100nF 10V ±5% 0603 (1608 Metric) Thickness 1mm SMD; Tolerance: Â±5%; Case-EIA: 0603; Case-Metric: 1608; Value: 100nF; Max Thickness: 1 mm; Rated Voltage: 10 V; Technology: SMT
D11 D12 = CMP-00278-103808874-1: NRVBSS34FA Schottky Barrier Rectifier Diode 40V 3A 2-Pin SOD−123FL T/R; Manufacturer Lifecycle Status: ACTIVE; Max Junction Temperature (Tj): 125°C; Capacitance: 152pF; Peak Reverse Current: 500µA; Max Forward Surge Current (Ifsm): 80A; RoHS: Compliant; Forward Current: 3A; Height: 1.43mm; Max Operating Temperature: 125°C; Min Operating Temperature: -55°C; Lifecycle Status: Production; Max Repetitive Reverse Voltage (Vrrm): 40V; Reverse Voltage: 40V; NexarPartId: 103808874
F1 F2 = 046802.5NR: Fuse; Manufacturer_Name: LITTELFUSE; Datasheet Link: https://www.littelfuse.com/assetdocs/fuse-468-datasheet?assetguid=6b7857dc-f79c-4aae-8bcc-a9ef11ddef09; Height: 0.762mm; Manufacturer_Part_Number: 046802.5NR; Mouser Part Number: 576-046802.5NR; Mouser Price/Stock: https://www.mouser.co.uk/ProductDetail/Littelfuse/046802.5NR?qs=lHGCbWr7UNKmLbgT05TGjg%3D%3D; Arrow Part Number: 046802.5NR; Arrow Price/Stock: https://www.arrow.com/en/products/046802.5nr/littelfuse?region=nac
IC1 = UCC27624DR: Integrated Circuit; Manufacturer_Name: Texas Instruments; Datasheet Link: https://www.ti.com/lit/ds/symlink/ucc27624.pdf?ts=1654150888910&ref_url=https%253A%252F%252Fwww.ti.com%252Fproduct%252FUCC27624; Height: 1.75mm; Manufacturer_Part_Number: UCC27624DR; Mouser Part Number: 595-UCC27624DR; Mouser Price/Stock: https://www.mouser.co.uk/ProductDetail/Texas-Instruments/UCC27624DR?qs=Rp5uXu7WBW%2FHvRoPIZ55DQ%3D%3D; Arrow Part Number: UCC27624DR; Arrow Price/Stock: https://www.arrow.com/en/products/ucc27624dr/texas-instruments?utm_currency=USD&region=nac
Q3 Q4 = CMP-12801-000047-1: MOSFET N-CH 60V 1.6A SOT23; Manufacturer: Diodes Inc.; Turn Off Delay Time: 16.3ns; Power Dissipation: 0.7W; Pulse Drain Current: 10A; Number Of Channels: 1; Reverse Recovery Time: 16.8ns; Typ Forward Diode Voltage: 0.75V; Gate To Source Voltage: 20V; Rthja Max: 183°C/W; Gate Charge At Vgs: 8.6nC @ 10V; Drain To Source Resistance: 92mΩ; Depletion Mode: False; Max Junction Temp: +150°C; Max Forward Diode Voltage: 1V; Reverse Recovery Charge: 9nC; Input Capacitace At Vds: 315pF @ 40V; Standoff Height: 0.013mm; Threshold Vgs Max: 3V; Turn On Delay Time: 2.6ns; Mouser Description: MOSFET 31V to 99V N-Ch FET 60Vds 20Vgs 2.3A; ComponentLink2Description: Datasheet; Digikey Description: MOSFET N-CH 60V 1.6A SOT23; Lead Free: Yes; Category: Trans; Device Class L3: MOSFETs; Temperature Range High: +150°C; Octopart: https://octopart.com/dmn6140l-13-diodes+inc.-38898616; Drain To Source Voltage: 60V; ComponentLink2URL: https://www.diodes.com/assets/Datasheets/DMN6140L.pdf; Drain To Source Breakdown Voltage: 60V; Footprint Url: https://www.diodes.com/assets/Package-Files/SOT23.pdf; Package: SOT23; Continuous Drain Current: 1.6A; Device Class L1: Discrete Semiconductors; Device Class L2: Transistors; Number Of N Channels: 1; Temperature Range Low: -55°C; Height: 1.1mm; Manufacturer Part Number: DMN6140L-13; RoHS: TRUE; Temperature: -55°C to +150°C; Threshold Vgs Min: 1V; Automotive: No
R43 R46 = CMP-009-00017-5: as R36 on sheet motor_interfaces; RoHS Compliant: True; Min Operating Temperature: -55°C; Pins: 2; Case/Package: 0603; Mounting Technology: SM; Max Operating Temperature: 155°C; Tolerance: 1%
R45 R49 = CMP-03412-032644-1: RES SMD 47 OHM 1% 1/10W 0603; Manufacturer: Yageo; Manufacturer Part Number: RT0603FRE0747RL; Power Rating: 0.1W; Value: 47Ω; Temperature Coefficient: 50 ppm/°C; Tolerance: 0.01; Voltage Rating: 75V; Device Class L2: Resistors; Octopart: https://octopart.com/rt0603fre0747rl-yageo-39813773; Ipc Land Pattern Name: RESC16080X45; Automotive: No; Footprint Url: http://www.yageo.com/exep/pages/download/literatures/PYu-R_Mount_10.pdf; Package: RT0603; Lead Free: Yes; Category: Res; Device Class L1: Passive Components; Series: RT; ComponentLink2Description: Datasheet; Temperature: -55°C to +155°C; Height: 0.55mm; Digikey Description: RES SMD 47 OHM 1% 1/10W 0603; Device Class L3: Chip SMD Resistors; Temperature Range Low: -55°C; ComponentLink2URL: http://www.yageo.com/documents/recent/PYu-RT_1-to-0.01_RoHS_L_9.pdf; Mouser Description: RT Series 0603 0.1 W 47 Ohm ±1 % ±50 ppm/°C SMT Thin Film Chip Resistor; RoHS: TRUE; Temperature Range High: +155°C; Composition: Thin Film; Resistance: 47Ω
R48 = CMP-03412-022575-2: RES 100KΩ 1.00% 0.1W 0603; Tolerance: 1%; Resistance: 100kR; RoHS Compliant: Yes; Case/Package: 0603

## Nets that join several sheets
+3V3: power (D5.1 TP_4.1), rp2040 (18 pins), motor_interfaces (IC2.8)
+5: top (12 pins), power (8 pins), motor_interfaces (U7.20), clutch_interface (C50.2 IC1.6 R48.2)
+12: top (J3.3 J4.3 J5.3 J6.3), power (C24.1 TP_3.1 U2.3)
+24: power (15 pins), clutch_interface (F1.1 F2.1)
+48: top (C1.2 C2.2 P1.3 P1.4), power (11 pins)
GND: top (23 pins), power (42 pins), rp2040 (31 pins), voltage_dividers (6 pins), motor_interfaces (8 pins), clutch_interface (6 pins)
BACK_LEFT_ANALOG: top (J12.2), motor_interfaces (IC2.6 IC2.7)
BACK_RIGHT_ANALOG: top (J15.2), motor_interfaces (IC2.1 IC2.2)
BRAKE_GND: top (J14.1), clutch_interface (D12.2 Q4.3)
BRAKE_POWER: top (J14.2), clutch_interface (D12.1 F2.2)
BrakeSense: top (J1.2), voltage_dividers (R33.2)
GPIO0: top (J8.2), rp2040 (U5.2)
GPIO1: top (J8.3), rp2040 (U5.3)
GPIO2: rp2040 (U5.4), motor_interfaces (R36.1)
GPIO3: rp2040 (U5.5), motor_interfaces (R38.1)
GPIO4: rp2040 (U5.6), clutch_interface (IC1.4 R43.2)
GPIO5: rp2040 (U5.7), clutch_interface (IC1.2 R46.2)
GPIO6: rp2040 (U5.8), voltage_dividers (R1.1 R3.2)
GPIO7: rp2040 (U5.9), voltage_dividers (R2.1 R4.2)
GPIO8: rp2040 (U5.11), voltage_dividers (R7.1 R8.2)
GPIO9: rp2040 (U5.12), voltage_dividers (R5.1 R6.2)
GPIO10: rp2040 (U5.13), motor_interfaces (U7.2)
GPIO11: rp2040 (U5.14), motor_interfaces (U7.4)
GPIO12: rp2040 (U5.15), motor_interfaces (U7.6)
GPIO13: rp2040 (U5.16), motor_interfaces (U7.11)
GPIO14: rp2040 (U5.17), motor_interfaces (U7.13)
GPIO15: rp2040 (U5.18), motor_interfaces (U7.15)
GPIO27_ADC1: rp2040 (U5.39), voltage_dividers (R33.1 R35.1)
GPIO28_ADC2: rp2040 (U5.40), voltage_dividers (R32.1 R34.1)
RPM_BACK_LEFT: top (J5.2 R11.1), voltage_dividers (R5.2)
RPM_BACK_RIGHT: top (J6.2 R12.1), voltage_dividers (R7.2)
RPM_FRONT_LEFT: top (J4.2 R10.1), voltage_dividers (R1.2)
RPM_FRONT_RIGHT: top (J3.2 R9.1), voltage_dividers (R2.2)
STEER_GND: top (J13.1), clutch_interface (D11.2 Q3.3)
STEER_POWER: top (J13.2), clutch_interface (D11.1 F1.2)
SteerAngle: top (J2.2), voltage_dividers (R32.2)
STEP_DIR1: top (J9.4), motor_interfaces (U7.16)
STEP_DIR2: top (J10.4), motor_interfaces (U7.7)
STEP_ENA1: top (J9.6), motor_interfaces (U7.14)
STEP_ENA2: top (J10.6), motor_interfaces (U7.5)
STEP_PUL1: top (J9.2), motor_interfaces (U7.18)
STEP_PUL2: top (J10.2), motor_interfaces (U7.9)